# Altium schematic sheet Current Sensor ADC.SchDoc
size A; SheetNumber: 5; SheetTotal: 5
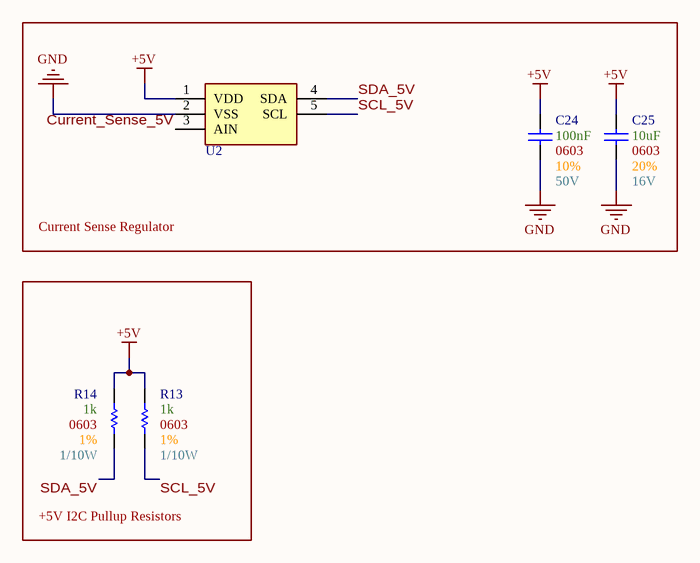
[diagram p0: Current Sensor ADC.SchDoc]

## Parts
C24  Max Voltage: 50V  Size Package: 0603  Tolerance: 10%  Capacitance: 100nF  [[Cap] SMD 0603]  (hidden comment: [Cap] 0603 0.1uF 10% 50V)
C25  Max Voltage: 16V  Size Package: 0603  Tolerance: 20%  Capacitance: 10uF  [[Cap] SMD 0603]  (hidden comment: [Cap] 0603 10uF 20% 16V)
R13  Wattage: 1/10W  Tolerance: 1%  Resistance: 1k  Size Package: 0603  [[Res] SMD 0603]  (hidden comment: [1k] SMD 0603 1% 1/10W)
R14  Wattage: 1/10W  Tolerance: 1%  Resistance: 1k  Size Package: 0603  [[Res] SMD 0603]  (hidden comment: [1k] SMD 0603 1% 1/10W)
U2  [ADC] 2.7-5.5V 12bit Single-Ended  [[ADC] 2.7-5.5V 12bit Single-Ended]  (value not drawn)

## Blocks framed on the sheet
Current Sense Regulator: C24 C25 U2
+5V I2C Pullup Resistors: R13 R14

## Nets
+5V: C24.2 C25.2 R13.2 R14.2 U2.1(VDD)
GND: C24.1 C25.1 U2.2(VSS)
Current_Sense_5V: U2.3(AIN)
SCL_5V: R13.1 U2.5(SCL)
SDA_5V: R14.1 U2.4(SDA)

## Library data of the parts
C24 = [Cap] 0603 0.1uF 10% 50V: CL10B104KB8NNNC; Supplier 1: DigiKey; Supplier Part Number 1: 1276-1000-6-ND
C25 = [Cap] 0603 10uF 20% 16V: GRM188C81C106MA73D; Supplier 1: DigiKey; Supplier Part Number 1: 490-7198-1-ND
R13 R14 = [1k] SMD 0603 1% 1/10W: RMCF0603FT1K00; Supplier 1: DigiKey; Supplier Part Number 1: RMCF0603FT1K00DKR-ND
U2 = [ADC] 2.7-5.5V 12bit Single-Ended: MCP3221A0T-E/OT; Supplier 1: DigiKey; Supplier Part Number 1: MCP3221A0T-E/OTCT-ND